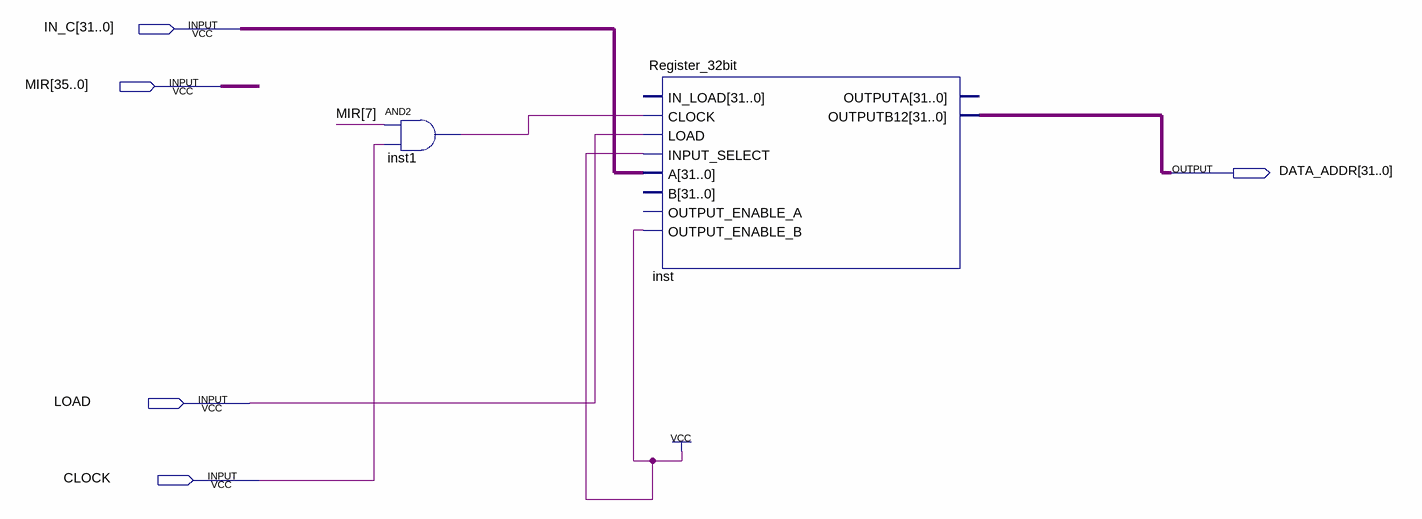
[diagram p0: schematic sheet]
// Quartus schematic MAR.bdf as structural Verilog: 2 symbols, 5 pins
module MAR (
  input  [31:0] IN_C,
  input  [35:0] MIR,
  input  LOAD,
  input  CLOCK,
  output [31:0] DATA_ADDR
);

  wire inst1_out;

  and inst1 (inst1_out, MIR[7], CLOCK);
  Register_32bit inst (
    .CLOCK(inst1_out), .LOAD(LOAD), .INPUT_SELECT(1'b1), .A(IN_C), .OUTPUT_ENABLE_B(1'b1),
    .OUTPUTB12(DATA_ADDR));  // open: IN_LOAD, B, OUTPUT_ENABLE_A, OUTPUTA
endmodule
